# Altium project Touch_Board_2.PrjPcb
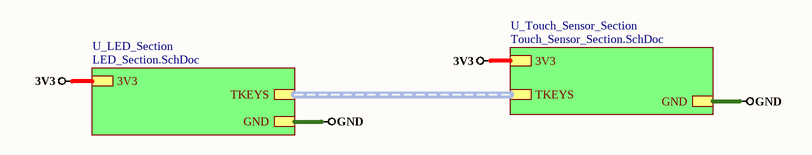
[diagram p0: Top_Sheet.SchDoc]
3 sheets, 42 parts. Net scope: hierarchical (ports join the sheet entries above them; power ports are global).
Board file: T_B 2.PcbDoc
Sheets:
  Top_Sheet.SchDoc
    U_Touch_Sensor_Section = Touch_Sensor_Section.SchDoc
    U_LED_Section = LED_Section.SchDoc

## Sheet Top_Sheet.SchDoc
size A4

### Sub-sheets
U_LED_Section = LED_Section.SchDoc: 3V3, GND, TKEYS (harness TKEYS)
U_Touch_Sensor_Section = Touch_Sensor_Section.SchDoc: 3V3, GND, TKEYS (harness TKEYS)

### Nets
3V3: sheet U_Touch_Sensor_Section/3V3, sheet U_LED_Section/3V3
GND: sheet U_Touch_Sensor_Section/GND, sheet U_LED_Section/GND

### Buses and harness runs
harness sheet U_LED_Section/TKEYS = sheet U_Touch_Sensor_Section/TKEYS

## Sheet Touch_Sensor_Section.SchDoc
size A4
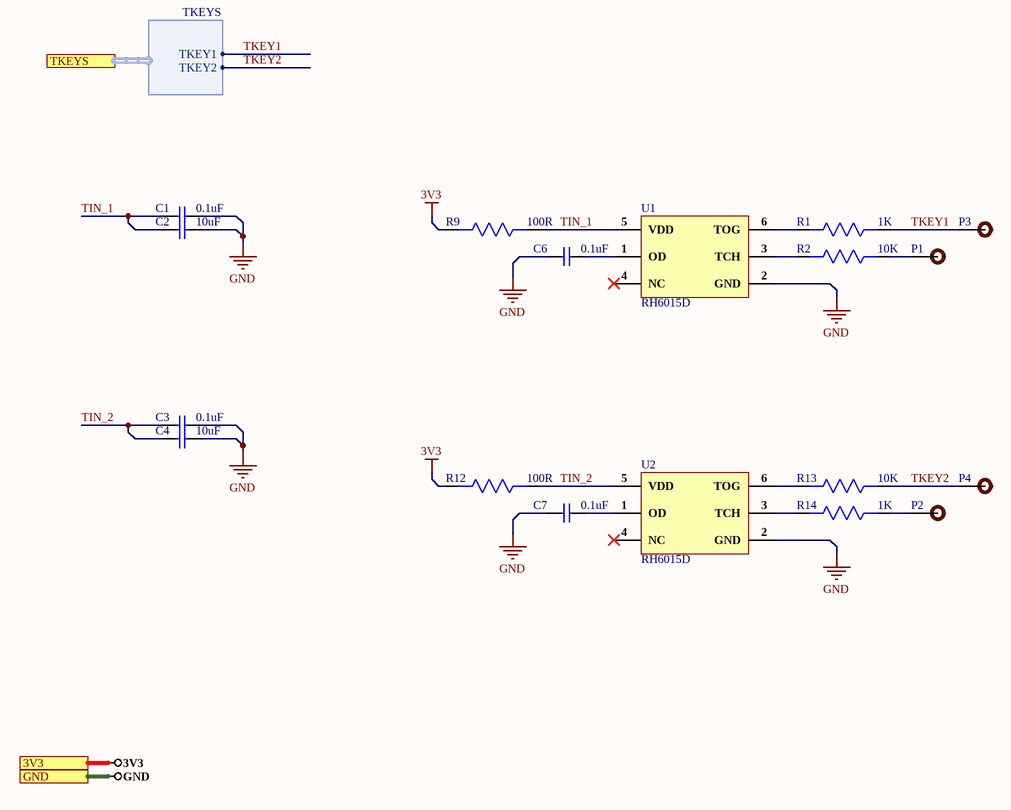
[diagram p1: Touch_Sensor_Section.SchDoc]

### Parts
C1  0.1uF  [Cap0805]
C2  10uF  [Cap0603]
C3  0.1uF  [Cap0805]
C4  10uF  [Cap0603]
C6  0.1uF  [Cap0805]
C7  0.1uF  [Cap0805]
P1  Test Point  [TEST POINT]  (value not drawn)
P2  Test Point  [TEST POINT]  (value not drawn)
P3  Test Point  [TEST POINT]  (value not drawn)
P4  Test Point  [TEST POINT]  (value not drawn)
R1  1K  [RES 0805]
R2  10K  [RES 0805]
R9  100R  [RES 0805]
R12  100R  [RES 0805]
R13  10K  [RES 0805]
R14  1K  [RES 0805]
U1  RH6015D  [SOT-23-6]
U2  RH6015D  [SOT-23-6]

### Ports
3V3, GND, TKEYS (harness TKEYS)

### Harnesses
TKEYS: TKEY1, TKEY2

### Nets
3V3: R9.2 R12.2 ; port 3V3
GND: C1.2 C2.2 C3.2 C4.2 C6.1 C7.1 U1.2(GND) U2.2(GND) ; port GND
TIN_1: C1.1 C2.1 R9.1 U1.5(VDD)
TIN_2: C3.1 C4.1 R12.1 U2.5(VDD)
TKEY1: P3.1 R1.1 ; port TKEYS.TKEY1
TKEY2: P4.1 R13.1 ; port TKEYS.TKEY2
NetC6_2: C6.2 U1.1(OD)
NetC7_2: C7.2 U2.1(OD)
NetP1_1: P1.1 R2.1
NetP2_1: P2.1 R14.1
NetR1_2: R1.2 U1.6(TOG)
NetR2_2: R2.2 U1.3(TCH)
NetR13_2: R13.2 U2.6(TOG)
NetR14_2: R14.2 U2.3(TCH)

Not connected (* = marked no-connect by the designer): U1 4(NC)*; U2 4(NC)*

### Library data of the parts
C1 C3 C6 C7 = 0805B104K500CT: CAP CER 0.1UF 50V X7R 0805; Manufacturer: Walsin Technologies; Tolerance: 10%; Capacitance: 100nF; Supplier 1: Digi-Key; Manufacturer Part Number: 0805B104K500CT; RoHS: Yes; Category: Ceramic Capacitors; Stock 1: 1274242; Pricing 1: 1=0.12000, 10=0.08600, 50=0.04900, 100=0.04050, 500=0.02842, 1000=0.02352 (USD); Case/Package: 0805; Case Code (Imperial): 0805; Case Code (Metric): 2012; Min Operating Temperature: -55°C; Max Operating Temperature: 125°C; Packaging: Tape and Reel; Voltage Rating: 50V; Dielectric: X7R; Voltage Rating (DC): 50V; Voltage: 50V; Length: 2mm; Depth: 1.25mm; Radiation Hardening: No; REACH SVHC: Unknown; Lead Free: Lead Free; ComponentLink1URL: http://www.farnell.com/datasheets/2340522.pdf?src-supplier=Farnell; ComponentLink1Description: http://www.farnell.com/datasheets/2340522.pdf?src-supplier=Farnell; ComponentLink2URL: http://components.arrow.com/part/dataview/0323_00650840?src-supplier=Arrow+Europe; ComponentLink2Description: http://components.arrow.com/part/dataview/0323_00650840?src-supplier=Arrow+Europe; ComponentLink3URL: https://www.verical.com/server-webapp/html/getDatasheet?partID=414849&src-supplier=Verical; ComponentLink3Description: https://www.verical.com/server-webapp/html/getDatasheet?partID=414849&src-supplier=Verical; ComponentLink4URL: http://www.farnell.com/datasheets/2340522.pdf?src-supplier=Element14; ComponentLink4Description: http://www.farnell.com/datasheets/2340522.pdf?src-supplier=Element14; ComponentLink5URL: http://www.passivecomponent.com/wp-content/uploads/2018/10/MLCC.pdf?src-supplier=Digi-Key; ComponentLink5Description: http://www.passivecomponent.com/wp-content/uploads/2018/10/MLCC.pdf?src-supplier=Digi-Key; ComponentLink6URL: http://www.passivecomponent.com/indexsea/0805B104K500CT-IB.pdf?src-supplier=Digi-Key; ComponentLink6Description: http://www.passivecomponent.com/indexsea/0805B104K500CT-IB.pdf?src-supplier=Digi-Key; ComponentLink7URL: http://www.farnell.com/datasheets/2340522.pdf?src-supplier=Newark; ComponentLink7Description: http://www.farnell.com/datasheets/2340522.pdf?src-supplier=Newark; Supplier Part Number 1: 1292-1647-1-ND
C2 C4 = C1608X5R1E106M080AC: CAP CER 10UF 25V X5R 0603; Manufacturer: TDK; Dielectric Material: Ceramic; Tolerance: 20%; Supplier 1: Digi-Key; Manufacturer Part Number: C1608X5R1E106M080AC; RoHS: Yes; Category: Ceramic Capacitors; Stock 1: 217631; Pricing 1: 1=0.86000, 10=0.60700, 50=0.45920, 100=0.39990, 500=0.29624, 1000=0.25180 (USD); Mount: Surface Mount; Case/Package: 0603; Case Code (Imperial): 0603; Case Code (Metric): 1608; Weight: 7.1E-05oz; Min Operating Temperature: -55°C; Max Operating Temperature: 85°C; Capacitance: 10uF; Packaging: Tape and Reel; Voltage Rating: 25V; Voltage Rating (DC): 25V; Termination: SMD/SMT; Series: C; Package Quantity: 1; Dielectric: X5R; Resistor Type: Ceramic; Construction: Flat; Length: 1.6mm; Width: 0.8mm; Height: 0.8mm; Thickness: 0.039inch; Depth: 0.8mm; Lead Free: Lead Free; REACH SVHC: No SVHC; RoHS Compliant: Yes; ComponentLink1URL: http://components.arrow.com/part/dataview/0323_06887183?src-supplier=Arrow+Europe; ComponentLink1Description: http://components.arrow.com/part/dataview/0323_06887183?src-supplier=Arrow+Europe; ComponentLink2URL: http://www.farnell.com/datasheets/2792994.pdf?src-supplier=Farnell; ComponentLink2Description: http://www.farnell.com/datasheets/2792994.pdf?src-supplier=Farnell; ComponentLink3URL: http://www.farnell.com/datasheets/2291921.pdf?src-supplier=Avnet; ComponentLink3Description: http://www.farnell.com/datasheets/2291921.pdf?src-supplier=Avnet; ComponentLink4URL: http://www.farnell.com/datasheets/1470445.pdf?src-supplier=Newark; ComponentLink4Description: http://www.farnell.com/datasheets/1470445.pdf?src-supplier=Newark; ComponentLink5URL: http://www.farnell.com/datasheets/2291921.pdf?src-supplier=Newark; ComponentLink5Description: http://www.farnell.com/datasheets/2291921.pdf?src-supplier=Newark; ComponentLink6URL: http://www.farnell.com/datasheets/2792994.pdf?src-supplier=Element14; ComponentLink6Description: http://www.farnell.com/datasheets/2792994.pdf?src-supplier=Element14; ComponentLink7URL: http://www.farnell.com/datasheets/1913358.pdf?src-supplier=Element14; ComponentLink7Description: http://www.farnell.com/datasheets/1913358.pdf?src-supplier=Element14; ComponentLink8URL: https://product.tdk.com/info/en/catalog/datasheets/mlcc_commercial_general_en.pdf?src-supplier=Digi-Key; ComponentLink8Description: https://product.tdk.com/info/en/catalog/datasheets/mlcc_commercial_general_en.pdf?src-supplier=Digi-Key; ComponentLink9URL: http://www.farnell.com/datasheets/2291921.pdf?src-supplier=RSComponents; ComponentLink9Description: http://www.farnell.com/datasheets/2291921.pdf?src-supplier=RSComponents; ComponentLink10URL: http://www.farnell.com/datasheets/2291921.pdf?src-supplier=Verical; ComponentLink10Description: http://www.farnell.com/datasheets/2291921.pdf?src-supplier=Verical; ComponentLink11URL: http://www.farnell.com/datasheets/2291921.pdf?src-supplier=Mouser; ComponentLink11Description: http://www.farnell.com/datasheets/2291921.pdf?src-supplier=Mouser; ComponentLink12URL: http://www.farnell.com/datasheets/2792994.pdf?src-supplier=Newark; ComponentLink12Description: http://www.farnell.com/datasheets/2792994.pdf?src-supplier=Newark; ComponentLink13URL: http://www.farnell.com/datasheets/2291921.pdf?src-supplier=Quest; ComponentLink13Description: http://www.farnell.com/datasheets/2291921.pdf?src-supplier=Quest; ComponentLink14URL: http://www.farnell.com/datasheets/2291921.pdf?src-supplier=TTI; ComponentLink14Description: http://www.farnell.com/datasheets/2291921.pdf?src-supplier=TTI; Supplier Part Number 1: 445-9015-1-ND
P1-P4 = TEST POINT: Test Point ON
R1 R14 = CRCW08051K00JNEB: RES SMD 1K OHM 5% 1/8W 0805; Manufacturer: Vishay Dale; Resistance: 1kR; Power Rating: 125mW; Voltage Rating: 150V; Temperature Coefficient: 200ppm/°C; Supplier 1: Digi-Key; Manufacturer Part Number: CRCW08051K00JNEB; RoHS: Yes; Category: Chip SMD Resistors; Stock 1: 4389; Pricing 1: 1=0.10000, 10=0.05000, 100=0.02040, 1000=0.00914, 2500=0.00794, 5000=0.00656 (USD); Case/Package: 0805; Number of Pins: 2; Weight: 0.000194oz; Case Code (Imperial): 0805; Case Code (Metric): 2012; Contact Plating: Tin; Min Operating Temperature: -55°C; Max Operating Temperature: 155°C; Packaging: Tape and Reel; Tolerance: 5%; Package Quantity: 10000; Resistor Type: Thick Film; Number of Terminations: 2; Termination: SMD/SMT; Max Power Dissipation: 125mW; Voltage Rating (DC): 150V; Features: Automotive AEC-Q200; Length: 0.079inch; Width: 0.049inch; Height: 0.02inch; Radiation Hardening: No; REACH SVHC: Unknown; Lead Free: Lead Free; ComponentLink1URL: https://datasheet.ciiva.com/5548/dcrcwe3-109170-5548326.pdf?src-supplier=Mouser; ComponentLink1Description: https://datasheet.ciiva.com/5548/dcrcwe3-109170-5548326.pdf?src-supplier=Mouser; ComponentLink2URL: https://datasheet.ciiva.com/28621/1747939-28621434.pdf?src-supplier=Element14; ComponentLink2Description: https://datasheet.ciiva.com/28621/1747939-28621434.pdf?src-supplier=Element14; Supplier Part Number 1: 541-CRCW08051K00JNEBCT-ND
R2 R13 = RMCF0805FT10K0: RES 10K OHM 1% 1/8W 0805; Manufacturer: Stackpole Electronics; Resistance: 10kR; Power Rating: 125mW; Temperature Coefficient: 100ppm/°C; Supplier 1: Digi-Key; Manufacturer Part Number: RMCF0805FT10K0; RoHS: Yes; Category: Chip SMD Resistors; Stock 1: 308321; Pricing 1: 1=0.10000, 10=0.02700, 100=0.01090, 1000=0.00488, 2500=0.00423 (USD); Mount: Surface Mount; Case/Package: 0805; Case Code (Metric): 2012; Case Code (Imperial): 0805; Contact Plating: Tin,Matte; Size Code: 0805; Min Operating Temperature: -55°C; Max Operating Temperature: 155°C; Tolerance: 1%; Packaging: Tape and Reel; Resistor Type: Thick Film; Number of Terminations: 2; Max Power Dissipation: 125mW; Features: Automotive AEC-Q200; Series: RMCF; Construction: Rectangular; Length: 2mm; Width: 0.049inch; Height: 0.026inch; Depth: 1.25mm; Radiation Hardening: No; Lead Free: Lead Free; Military Standard: Not; RoHS Compliant: Yes; ComponentLink1URL: https://datasheet.ciiva.com/15193/getdatasheetpartid-362046-15193525.pdf?src-supplier=Verical; ComponentLink1Description: https://datasheet.ciiva.com/15193/getdatasheetpartid-362046-15193525.pdf?src-supplier=Verical; Supplier Part Number 1: RMCF0805FT10K0CT-ND
R9 R12 = ERA6VEB1000V: Res SMD 100 Ohm 0.10% 1/8W 0805; Manufacturer: Panasonic; Manufacturer Part Number: ERA-6VEB1000V; Supplier 1: Digi-Key; RoHS: No; Category: Chip SMD Resistors; Stock 1: 2703; Pricing 1: 1=0.56000, 10=0.46700, 100=0.31350, 1000=0.18342, 2500=0.18142 (USD); Supplier Part Number 1: 10-ERA-6VEB1000VCT-ND
U1 U2 = RH6015D: SOT-23-6L Touch Sensors RoHS; Manufacturer: RONGHE Microelectronics; Value: Custom; Manufacturer Part No: RH6015D; Package: SOT-23-6

## Sheet LED_Section.SchDoc
size A4
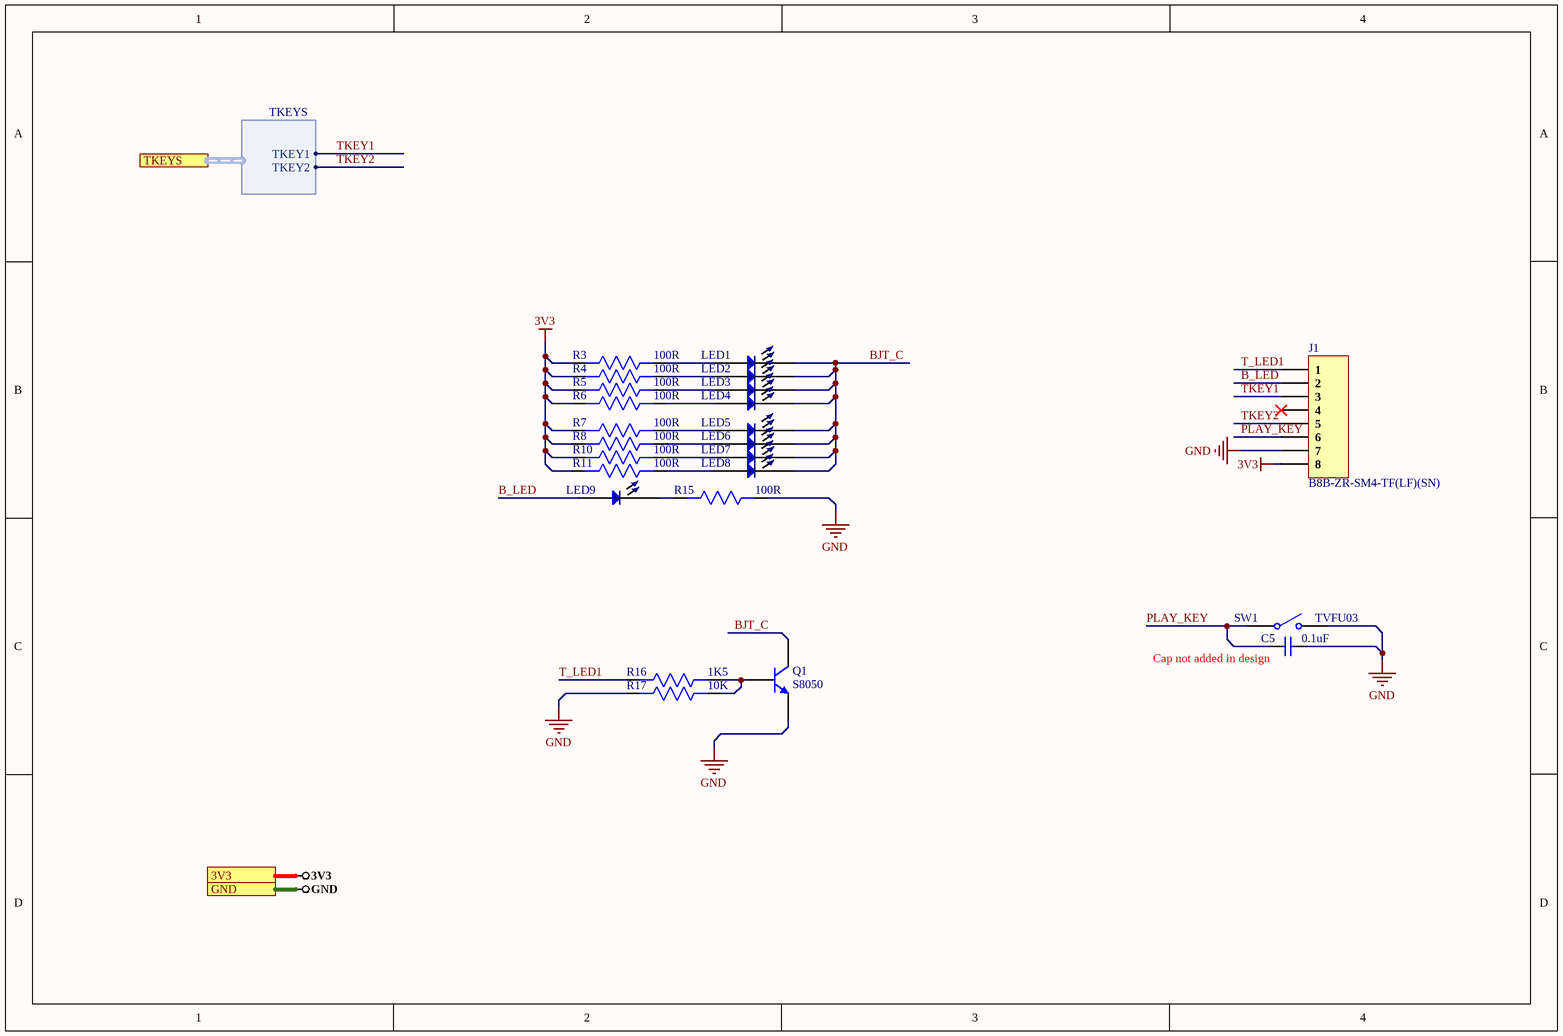
[diagram p2: LED_Section.SchDoc]

### Parts
C5  0.1uF  [Cap0805]
J1  B8B-ZR-SM4-TF(LF)(SN)  [B8B-ZR-SM4-TF(LF)(SN)]
LED1  150080GS75000  [LED 0805]  (value not drawn)
LED2  150080GS75000  [LED 0805]  (value not drawn)
LED3  150080GS75000  [LED 0805]  (value not drawn)
LED4  150080GS75000  [LED 0805]  (value not drawn)
LED5  150080GS75000  [LED 0805]  (value not drawn)
LED6  150080GS75000  [LED 0805]  (value not drawn)
LED7  150080GS75000  [LED 0805]  (value not drawn)
LED8  150080GS75000  [LED 0805]  (value not drawn)
LED9  150080GS75000  [LED 0805]  (value not drawn)
Q1  S8050  [sot-23]
R3  100R  [RES 0805]
R4  100R  [RES 0805]
R5  100R  [RES 0805]
R6  100R  [RES 0805]
R7  100R  [RES 0805]
R8  100R  [RES 0805]
R10  100R  [RES 0805]
R11  100R  [RES 0805]
R15  100R  [RES 0805]
R16  1K5  [RES 0805]
R17  10K  [RES 0805]
SW1  TVFU03  [TVFU03]

### Ports
3V3, GND, TKEYS (harness TKEYS)

### Harnesses
TKEYS: TKEY1, TKEY2

### Nets
3V3: J1.8 R3.2 R4.2 R5.2 R6.2 R7.2 R8.2 R10.2 R11.2 ; port 3V3
GND: C5.2 J1.7 Q1.2(E) R15.1 R17.2 SW1.2 ; port GND
B_LED: J1.2 LED9.1
BJT_C: LED1.2 LED2.2 LED3.2 LED4.2 LED5.2 LED6.2 LED7.2 LED8.2 Q1.3(C)
PLAY_KEY: C5.1 J1.6 SW1.1
T_LED1: J1.1 R16.2
TKEY1: J1.3 ; port TKEYS.TKEY1
TKEY2: J1.5 ; port TKEYS.TKEY2
NetLED1_1: LED1.1 R3.1
NetLED2_1: LED2.1 R4.1
NetLED3_1: LED3.1 R5.1
NetLED4_1: LED4.1 R6.1
NetLED5_1: LED5.1 R7.1
NetLED6_1: LED6.1 R8.1
NetLED7_1: LED7.1 R10.1
NetLED8_1: LED8.1 R11.1
NetLED9_2: LED9.2 R15.2
NetQ1_1: Q1.1(B) R16.1 R17.1

Not connected (* = marked no-connect by the designer): J1 4*

### Notes on the sheet
- (near C5) Cap not added in design

### Library data of the parts
C5 = 0805B104K500CT: as C1 on sheet Touch_Sensor_Section; Supplier 1: Digi-Key; Manufacturer Part Number: 0805B104K500CT; RoHS: Yes; Category: Ceramic Capacitors; Stock 1: 1274242; Pricing 1: 1=0.12000, 10=0.08600, 50=0.04900, 100=0.04050, 500=0.02842, 1000=0.02352 (USD); Case/Package: 0805; Case Code (Imperial): 0805; Case Code (Metric): 2012; Min Operating Temperature: -55°C; Max Operating Temperature: 125°C; Packaging: Tape and Reel; Voltage Rating: 50V; Dielectric: X7R; Voltage Rating (DC): 50V; Voltage: 50V; Length: 2mm; Depth: 1.25mm; Radiation Hardening: No; REACH SVHC: Unknown; Lead Free: Lead Free; ComponentLink1URL: http://www.farnell.com/datasheets/2340522.pdf?src-supplier=Farnell; ComponentLink1Description: http://www.farnell.com/datasheets/2340522.pdf?src-supplier=Farnell; ComponentLink2URL: http://components.arrow.com/part/dataview/0323_00650840?src-supplier=Arrow+Europe; ComponentLink2Description: http://components.arrow.com/part/dataview/0323_00650840?src-supplier=Arrow+Europe; ComponentLink3URL: https://www.verical.com/server-webapp/html/getDatasheet?partID=414849&src-supplier=Verical; ComponentLink3Description: https://www.verical.com/server-webapp/html/getDatasheet?partID=414849&src-supplier=Verical; ComponentLink4URL: http://www.farnell.com/datasheets/2340522.pdf?src-supplier=Element14; ComponentLink4Description: http://www.farnell.com/datasheets/2340522.pdf?src-supplier=Element14; ComponentLink5URL: http://www.passivecomponent.com/wp-content/uploads/2018/10/MLCC.pdf?src-supplier=Digi-Key; ComponentLink5Description: http://www.passivecomponent.com/wp-content/uploads/2018/10/MLCC.pdf?src-supplier=Digi-Key; ComponentLink6URL: http://www.passivecomponent.com/indexsea/0805B104K500CT-IB.pdf?src-supplier=Digi-Key; ComponentLink6Description: http://www.passivecomponent.com/indexsea/0805B104K500CT-IB.pdf?src-supplier=Digi-Key; ComponentLink7URL: http://www.farnell.com/datasheets/2340522.pdf?src-supplier=Newark; ComponentLink7Description: http://www.farnell.com/datasheets/2340522.pdf?src-supplier=Newark; Supplier Part Number 1: 1292-1647-1-ND
J1 = B8B-ZR-SM4-TF(LF)(SN): Conn Shrouded Header HDR 8 POS 1.5mm Solder ST SMD T/R; Manufacturer: JST; Number of Positions: 8; Connector Type: Male Pin; Current Rating: 1A; Gender: Male; Contact Resistance: 30mR; Max Voltage Rating (AC): 50V; Supplier 1: Digi-Key; Manufacturer Part Number: B8B-ZR-SM4-TF(LF)(SN); RoHS: Yes; Category: Board to Board Connectors; Pricing 1: 1=0.80000, 10=0.70700, 100=0.60970, 500=0.49886 (USD); Mount: Surface Mount; Contact Plating: Tin,Copper; Contact Material: Tin,Brass; Color: Natural; Housing Color: Beige; Housing Material: Polyamide; Min Operating Temperature: -25°C; Max Operating Temperature: 85°C; Number of Rows: 1; Packaging: Tape and Reel; Termination: Solder; Number of Contacts: 8; Max Current Rating: 1A; Fastening Type: Detent; Orientation: Right Angle; Length: 15mm; Width: 3.5mm; Height: 7.2mm; Pitch: 1.5mm; Depth: 6.5mm; Lead Free: Lead Free; ComponentLink1URL: https://datasheet.ciiva.com/26894/getdatasheetpartid-640747-26894507.pdf?src-supplier=Verical; ComponentLink1Description: https://datasheet.ciiva.com/26894/getdatasheetpartid-640747-26894507.pdf?src-supplier=Verical; ComponentLink2URL: https://datasheet.ciiva.com/16418/ezr-16418253.pdf?src-supplier=Future+Electronics; ComponentLink2Description: https://datasheet.ciiva.com/16418/ezr-16418253.pdf?src-supplier=Future+Electronics; Supplier Part Number 1: 455-1687-1-ND
LED1-LED9 = 150080GS75000: LED GREEN CLEAR 0805 SMD; Manufacturer: Wurth Electronics; Viewing Angle: 140°; Lens Style: Clear,Rectangular; Luminous Intensity: 450mcd; Forward Voltage: 3.2V; Wavelength: 520nm; Forward Current: 30mA; Test Current: 20mA; Supplier 1: Digi-Key; Manufacturer Part Number: 150080GS75000; RoHS: Yes; Category: LEDs; Stock 1: 96823; Pricing 1: 1=0.18000, 50=0.16500, 100=0.14200, 500=0.12300 (USD); Mount: Surface Mount; Case/Package: 0805; Color: Green; Case Code (Metric): 2012; Case Code (Imperial): 0805; Min Operating Temperature: -40°C; Max Operating Temperature: 85°C; Package Quantity: 4000; Packaging: Cut Tape; Dominant Wavelength: 520nm; Length: 2mm; Width: 1.25mm; Height: 0.7mm; REACH SVHC: Unknown; RoHS Compliant: Yes; ComponentLink1URL: https://datasheet.ciiva.com/29563/150080gs75000-29563008.pdf?src-supplier=Digi-Key; ComponentLink1Description: https://datasheet.ciiva.com/29563/150080gs75000-29563008.pdf?src-supplier=Digi-Key; ComponentLink2URL: https://datasheet.ciiva.com/29279/759434-da-01-en-chipled-0805-w-kl-gruen-150080gs75000-29279039.pdf?src-supplier=Conrad; ComponentLink2Description: https://datasheet.ciiva.com/29279/759434-da-01-en-chipled-0805-w-kl-gruen-150080gs75000-29279039.pdf?src-supplier=Conrad; Supplier Part Number 1: 732-4983-1-ND
Q1 = S8050: NPN 500mA 25V 300mW SOT-23(SOT-23-3) Bipolar Transistors - BJT RoHS; Manufacturer: Shikues; Package: SOT-23(SOT-23-3); Transistor Type: NPN; Current - Collector (Ic) (Max): 500mA; Voltage - Collector Emitter Breakdown (Max): 25V; Power-max: 300mW
R3-R8 R10 R11 R15 = ERA6VEB1000V: as R9 on sheet Touch_Sensor_Section; Supplier 1: Digi-Key; RoHS: No; Category: Chip SMD Resistors; Stock 1: 2703; Pricing 1: 1=0.56000, 10=0.46700, 100=0.31350, 1000=0.18342, 2500=0.18142 (USD); Supplier Part Number 1: 10-ERA-6VEB1000VCT-ND
R16 = RC0805JR-071K5L: RES SMD 1K5 0.125W ±5% 0805; Manufacturer: Yageo; Resistance: 1.5kR; Temperature Coefficient: 100ppm/°C; Power Rating: 125mW; Voltage Rating: 150V; Supplier 1: Future Electronics; Manufacturer Part Number: RC0805JR-071K5L; RoHS: Yes; Category: Chip SMD Resistors; Stock 1: 115000; Pricing 1: 5000=0.00390, 20000=0.00330, 75000=0.00320, 125000=0.00320, 250000=0.00310 (USD); Case/Package: 0805; Contact Plating: Tin,Matte,Lead; Case Code (Imperial): 0805; Case Code (Metric): 2012; Size Code: 0805; Min Operating Temperature: -55°C; Max Operating Temperature: 155°C; Tolerance: 5%; Resistor Type: Thick Film; Packaging: Tape and Reel; Package Quantity: 1; Termination: SMD/SMT; Number of Terminations: 2; Max Power Dissipation: 125mW; Features: Moisture Resistant; Series: RC; Resistance Tolerance: 5%; Construction: Rectangular; Length: 0.079inch; Width: 0.049inch; Height: 0.024inch; Depth: 1.25mm; Radiation Hardening: No; REACH SVHC: Unknown; Military Standard: Not; Lead Free: Lead Free; RoHS Compliant: Yes; ComponentLink1URL: https://datasheet.ciiva.com/2456/pyu-r-int-thick-7-2456073.pdf?src-supplier=Digi-Key; ComponentLink1Description: https://datasheet.ciiva.com/2456/pyu-r-int-thick-7-2456073.pdf?src-supplier=Digi-Key; ComponentLink2URL: https://datasheet.ciiva.com/2456/pyu-r-int-thick-7-2456074.pdf?src-supplier=Digi-Key; ComponentLink2Description: https://datasheet.ciiva.com/2456/pyu-r-int-thick-7-2456074.pdf?src-supplier=Digi-Key; ComponentLink3URL: https://datasheet.ciiva.com/17026/rc0805-17026842.pdf?src-supplier=Future+Electronics; ComponentLink3Description: https://datasheet.ciiva.com/17026/rc0805-17026842.pdf?src-supplier=Future+Electronics; ComponentLink4URL: https://datasheet.ciiva.com/46395/444164-46395130.pdf?src-supplier=Element14; ComponentLink4Description: https://datasheet.ciiva.com/46395/444164-46395130.pdf?src-supplier=Element14; ComponentLink5URL: https://datasheet.ciiva.com/2456/pyu-r-int-thick-7-2456075.pdf?src-supplier=Digi-Key; ComponentLink5Description: https://datasheet.ciiva.com/2456/pyu-r-int-thick-7-2456075.pdf?src-supplier=Digi-Key; Supplier Part Number 1: 1655711
R17 = RMCF0805FT10K0: as R2 on sheet Touch_Sensor_Section; Supplier 1: Digi-Key; Manufacturer Part Number: RMCF0805FT10K0; RoHS: Yes; Category: Chip SMD Resistors; Stock 1: 308321; Pricing 1: 1=0.10000, 10=0.02700, 100=0.01090, 1000=0.00488, 2500=0.00423 (USD); Mount: Surface Mount; Case/Package: 0805; Case Code (Metric): 2012; Case Code (Imperial): 0805; Contact Plating: Tin,Matte; Size Code: 0805; Min Operating Temperature: -55°C; Max Operating Temperature: 155°C; Tolerance: 1%; Packaging: Tape and Reel; Resistor Type: Thick Film; Number of Terminations: 2; Max Power Dissipation: 125mW; Features: Automotive AEC-Q200; Series: RMCF; Construction: Rectangular; Length: 2mm; Width: 0.049inch; Height: 0.026inch; Depth: 1.25mm; Radiation Hardening: No; Lead Free: Lead Free; Military Standard: Not; RoHS Compliant: Yes; ComponentLink1URL: https://datasheet.ciiva.com/15193/getdatasheetpartid-362046-15193525.pdf?src-supplier=Verical; ComponentLink1Description: https://datasheet.ciiva.com/15193/getdatasheetpartid-362046-15193525.pdf?src-supplier=Verical; Supplier Part Number 1: RMCF0805FT10K0CT-ND
SW1 = TVFU03: 6mm 2 pin smd soft touch long travel silent tact switch; Manufacturer: Zhejiang, China; Value: Custom; Manufacturer Part No: TVFU03; Package: Custom; ComponentLink1Description: Supplier Link; ComponentLink1URL: https://www.alibaba.com/product-detail/6mm-2-pin-smd-soft-touch_324641074.html

## Nets that join several sheets
3V3: Touch_Sensor_Section (R9.2 R12.2), LED_Section (9 pins)
GND: Touch_Sensor_Section (8 pins), LED_Section (6 pins)
TKEY1: Touch_Sensor_Section (P3.1 R1.1), LED_Section (J1.3)
TKEY2: Touch_Sensor_Section (P4.1 R13.1), LED_Section (J1.5)